# Altium project LogNController-v1.1.PrjPcb (part 1 of 3)
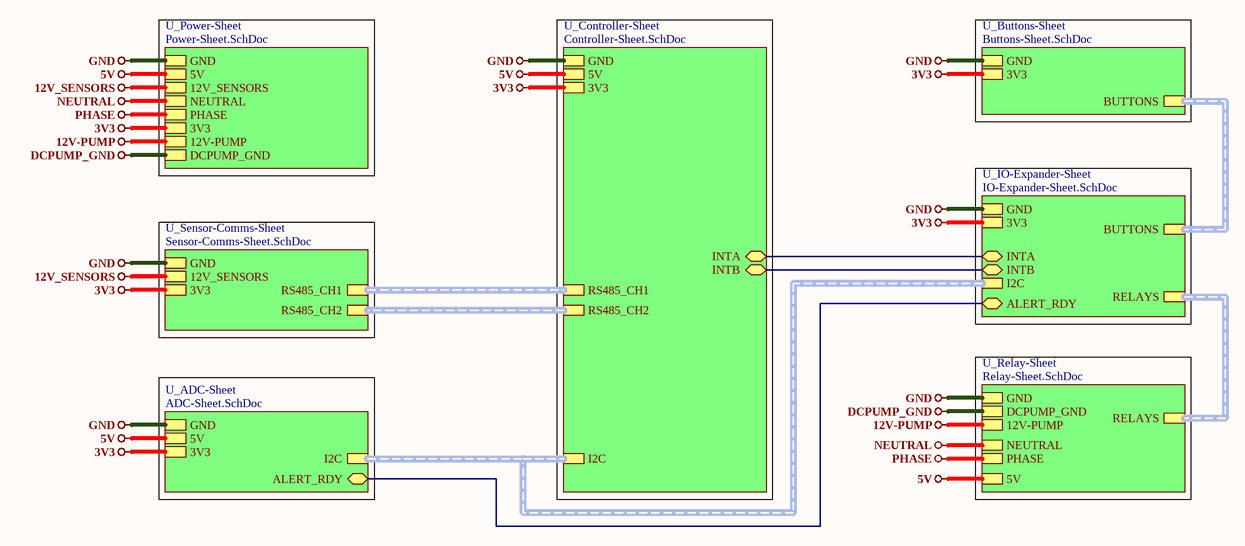
[diagram p0: Top-Sheet.SchDoc]
8 sheets, 172 parts. Net scope: hierarchical (ports join the sheet entries above them; power ports are global).
Board file: PCB_LogNController-v1.1.PcbDoc
Sheets:
  Top-Sheet.SchDoc
    U_Power-Sheet = Power-Sheet.SchDoc
    U_Sensor-Comms-Sheet = Sensor-Comms-Sheet.SchDoc
    U_ADC-Sheet = ADC-Sheet.SchDoc
    U_Buttons-Sheet = Buttons-Sheet.SchDoc
    U_IO-Expander-Sheet = IO-Expander-Sheet.SchDoc
    U_Relay-Sheet = Relay-Sheet.SchDoc
    U_Controller-Sheet = Controller-Sheet.SchDoc

## Sheet Top-Sheet.SchDoc
size A4; SheetNumber: 1; SheetTotal: 8

### Sub-sheets
U_ADC-Sheet = ADC-Sheet.SchDoc: GND, 5V, 3V3, ALERT_RDY (bidir), I2C (harness I2C)
U_Buttons-Sheet = Buttons-Sheet.SchDoc: GND, 3V3, BUTTONS (harness BUTTONS)
U_Controller-Sheet = Controller-Sheet.SchDoc: GND, 5V, 3V3, I2C (harness I2C), RS485_CH2 (harness RS485_CH2), RS485_CH1 (harness RS485_CH1), INTB (bidir), INTA (bidir)
U_IO-Expander-Sheet = IO-Expander-Sheet.SchDoc: GND, 3V3, BUTTONS (harness BUTTONS), ALERT_RDY (bidir), RELAYS (harness RELAYS), INTB (bidir), INTA (bidir), I2C (harness I2C)
U_Power-Sheet = Power-Sheet.SchDoc: GND, 5V, 12V_SENSORS, NEUTRAL, PHASE, 3V3, 12V-PUMP, DCPUMP_GND
U_Relay-Sheet = Relay-Sheet.SchDoc: RELAYS (harness RELAYS), GND, 5V, NEUTRAL, PHASE, 12V-PUMP, DCPUMP_GND
U_Sensor-Comms-Sheet = Sensor-Comms-Sheet.SchDoc: GND, 12V_SENSORS, 3V3, RS485_CH2 (harness RS485_CH2), RS485_CH1 (harness RS485_CH1)

### Nets
3V3: sheet U_Power-Sheet/3V3, sheet U_Sensor-Comms-Sheet/3V3, sheet U_ADC-Sheet/3V3, sheet U_Buttons-Sheet/3V3, sheet U_IO-Expander-Sheet/3V3, sheet U_Controller-Sheet/3V3
5V: sheet U_Power-Sheet/5V, sheet U_ADC-Sheet/5V, sheet U_Relay-Sheet/5V, sheet U_Controller-Sheet/5V
12V-PUMP: sheet U_Power-Sheet/12V-PUMP, sheet U_Relay-Sheet/12V-PUMP
12V_SENSORS: sheet U_Power-Sheet/12V_SENSORS, sheet U_Sensor-Comms-Sheet/12V_SENSORS
DCPUMP_GND: sheet U_Power-Sheet/DCPUMP_GND, sheet U_Relay-Sheet/DCPUMP_GND
GND: sheet U_Power-Sheet/GND, sheet U_Sensor-Comms-Sheet/GND, sheet U_ADC-Sheet/GND, sheet U_Buttons-Sheet/GND, sheet U_IO-Expander-Sheet/GND, sheet U_Relay-Sheet/GND, sheet U_Controller-Sheet/GND
NEUTRAL: sheet U_Power-Sheet/NEUTRAL, sheet U_Relay-Sheet/NEUTRAL
PHASE: sheet U_Power-Sheet/PHASE, sheet U_Relay-Sheet/PHASE
ALERT_RDY: sheet U_ADC-Sheet/ALERT_RDY, sheet U_IO-Expander-Sheet/ALERT_RDY
INTA: sheet U_IO-Expander-Sheet/INTA, sheet U_Controller-Sheet/INTA
INTB: sheet U_IO-Expander-Sheet/INTB, sheet U_Controller-Sheet/INTB

### Buses and harness runs
harness sheet U_ADC-Sheet/I2C = sheet U_Controller-Sheet/I2C = sheet U_IO-Expander-Sheet/I2C
harness sheet U_Buttons-Sheet/BUTTONS = sheet U_IO-Expander-Sheet/BUTTONS
harness sheet U_Controller-Sheet/RS485_CH1 = sheet U_Sensor-Comms-Sheet/RS485_CH1
harness sheet U_Controller-Sheet/RS485_CH2 = sheet U_Sensor-Comms-Sheet/RS485_CH2
harness sheet U_IO-Expander-Sheet/RELAYS = sheet U_Relay-Sheet/RELAYS

### Notes on the sheet
- File:
- Title:
- Date:
- Page
- Num:
- Total:
- Drawn By: Huzaifa Ali

## Sheet Power-Sheet.SchDoc
size A4; SheetNumber: 2; SheetTotal: 8
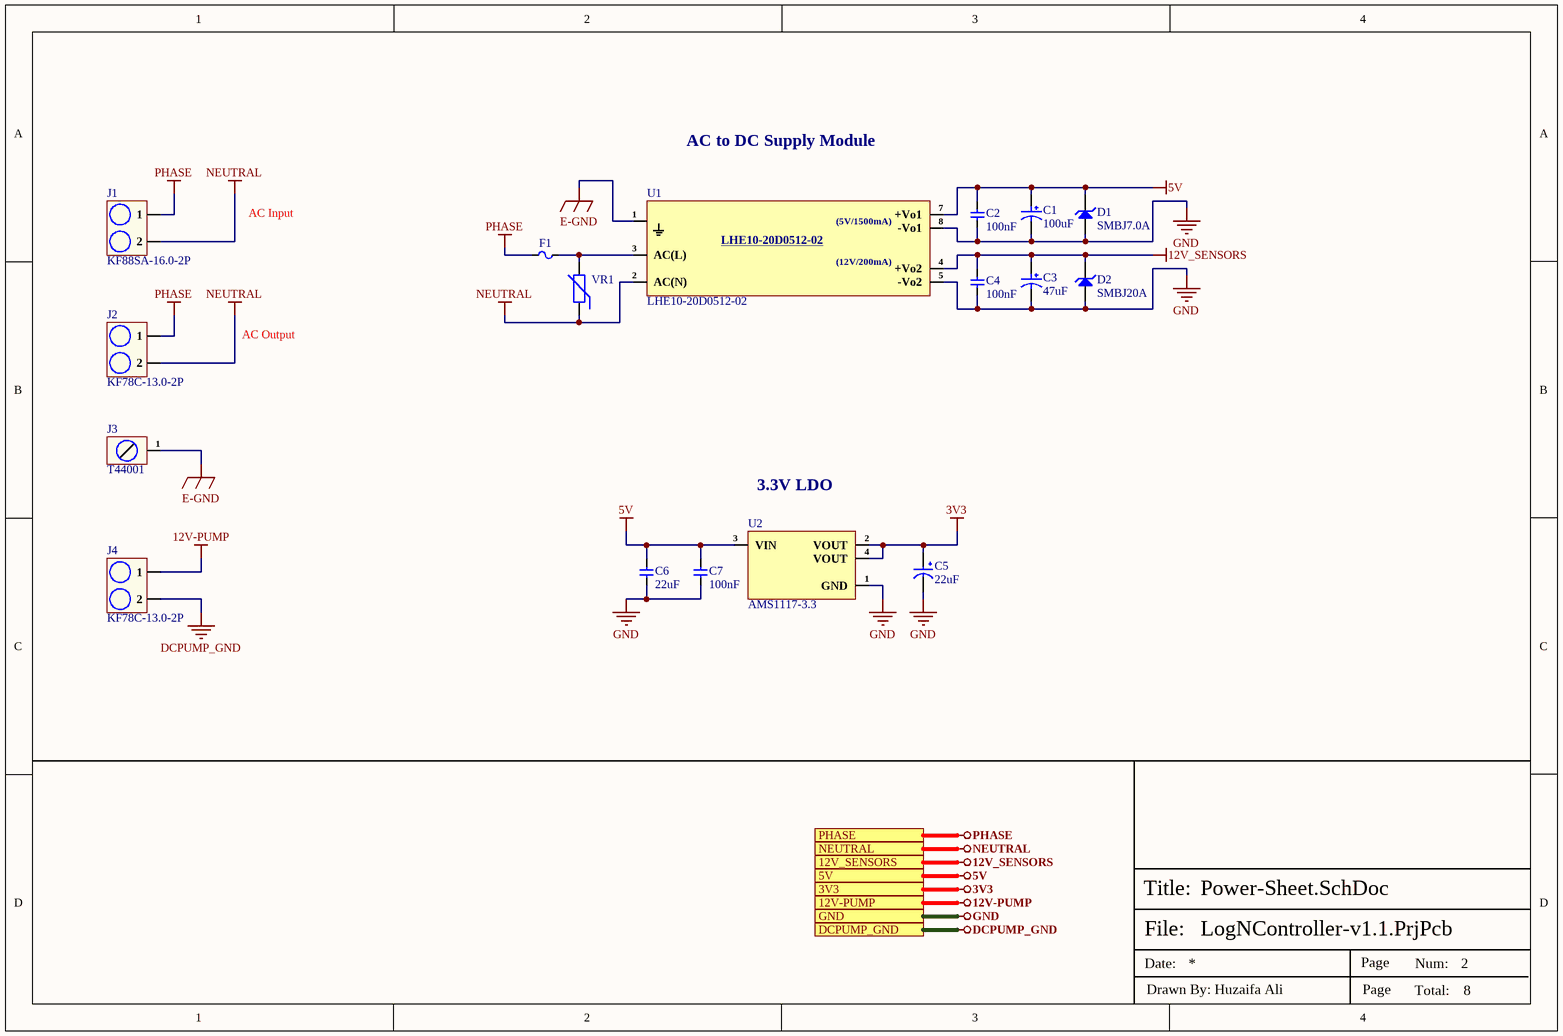
[diagram p1: Power-Sheet.SchDoc]

### Parts
C1  100uF  [25SVPF100M.]
C2  100nF  [Cap-0603]
C3  47uF  [RVT1H470M0607]
C4  100nF  [Cap-0603]
C5  22uF  [Case-B]
C6  22uF  [Cap-0603]
C7  100nF  [Cap-0603]
D1  SMBJ7.0A  [SMB_]
D2  SMBJ20A  [SMB_]
F1  2010T1A250V  [2010T1A250V]  (value not drawn)
J1  KF88SA-16.0-2P  [KF88SA-16.0-2P]
J2  KF78C-13.0-2P  [KF78C-13.0-2P]
J3  T44001  [T44001]
J4  KF78C-13.0-2P  [KF78C-13.0-2P]
U1  LHE10-20D0512-02  [LHE10-20D0512-02]
U2  AMS1117-3.3  [SOT- 223]
VR1  V300LT20AP  [V300LT20AP]  (value not drawn)

### Ports
3V3 (see Top-Sheet[1B], ADC-Sheet[3D], Buttons-Sheet[3D], Controller-Sheet[3D], IO-Expander-Sheet[3D], Sensor-Comms-Sheet[3D]), 5V (see Top-Sheet[1A], ADC-Sheet[3D], Controller-Sheet[3D], Relay-Sheet[3D]), 12V-PUMP (see Top-Sheet[1B], Relay-Sheet[3D]), 12V_SENSORS (see Top-Sheet[1A], Sensor-Comms-Sheet[3D]), DCPUMP_GND (see Top-Sheet[1B], Relay-Sheet[3D]), GND (see Top-Sheet[1A], ADC-Sheet[3D], Buttons-Sheet[3D], Controller-Sheet[3D], IO-Expander-Sheet[3D], Relay-Sheet[3D], Sensor-Comms-Sheet[3D]), NEUTRAL (see Top-Sheet[1A], Relay-Sheet[3D]), PHASE (see Top-Sheet[1B], Relay-Sheet[3D])

### Nets
3V3: C5.1 U2.2(VOUT) U2.4(VOUT) ; port 3V3
5V: C1.1 C2.2 C6.2 C7.2 D1.2(K) U1.7(+Vo1) U2.3(VIN) ; port 5V
12V-PUMP: J4.1 ; port 12V-PUMP
12V_SENSORS: C3.1 C4.2 D2.2(K) U1.4(+Vo2) ; port 12V_SENSORS
DCPUMP_GND: J4.2 ; port DCPUMP_GND
E-GND: J3.1 U1.1
GND: C1.2 C2.1 C3.2 C4.1 C5.2 C6.1 C7.1 D1.1(A) D2.1(A) U1.5(-Vo2) U1.8(-Vo1) U2.1(GND) ; port GND
NEUTRAL: J1.2 J2.2 U1.2(AC(N)) VR1.1 ; port NEUTRAL
PHASE: F1.1 J1.1 J2.1 ; port PHASE
NetF1_2: F1.2 U1.3(AC(L)) VR1.2

### Notes on the sheet
- AC to DC Supply Module
- AC Input
- AC Output
- (near U2) 3.3V LDO
- File:
- Title:
- Date:
- Page
- Num:
- Total:
- Drawn By: Huzaifa Ali
- (in symbol LHE10-20D0512-02) (5V/1500mA); (12V/200mA)

### Library data of the parts
C1 = 25SVPF100M: CAP ALUM POLY 100UF 20% 25V SMD; Manufacturer: Panasonic; Ripple Current: 3.2A; ESR (Equivalent Series Resistance): 24mR; Leakage Current: 500uA; Life (Hours): 5000Hour; Dissipation Factor: 12%; Item Type: Capacitor; Supplier 1: Digi-Key; Manufacturer Part Number: 25SVPF100M; RoHS: Yes; Category: Aluminum Electrolytic Capacitors; Stock 1: 5809; Pricing 1: 1=1.68000, 10=1.32800, 50=1.15080, 100=0.99590, 500=0.75246 (USD); Mount: Surface Mount; Case/Package: Radial; Number of Pins: 7; Min Operating Temperature: -55°C; Max Operating Temperature: 105°C; Capacitance: 100uF; Tolerance: 20%; Voltage Rating: 25V; Ripple Current (AC): 3.2A; Packaging: Tape and Reel; Package Quantity: 1000; Voltage Rating (DC): 25V; Termination: SMD/SMT; Voltage: 25V; Series: OS-CON, SVPF; Diameter: 8mm; Length: 6.9mm; Height: 6.9mm; Height - Seated (Max): 0.276inch; Reach SVHC Compliant: Yes; Lead Free: Lead Free; RoHS Compliant: Yes; ComponentLink1URL: https://datasheet.ciiva.com/25746/1734360-25746518.pdf?src-supplier=Farnell; ComponentLink1Description: https://datasheet.ciiva.com/25746/1734360-25746518.pdf?src-supplier=Farnell; ComponentLink2URL: https://datasheet.ciiva.com/22746/1734360-22746213.pdf?src-supplier=Element14; ComponentLink2Description: https://datasheet.ciiva.com/22746/1734360-22746213.pdf?src-supplier=Element14; ComponentLink3URL: https://datasheet.ciiva.com/24064/svpf-os-262415-24064540.pdf?src-supplier=Mouser; ComponentLink3Description: https://datasheet.ciiva.com/24064/svpf-os-262415-24064540.pdf?src-supplier=Mouser; Supplier Part Number 1: P123675CT-ND; LCSC Part Number: C136279
C2 C4 C7 = CC0603KRX5R9BB104: CAP CER 0.1UF 50V X5R 0603; Manufacturer: Yageo; Tolerance: 10%; Item Type: Capacitor; Supplier 1: Digi-Key; Manufacturer Part Number: CC0603KRX5R9BB104; RoHS: Yes; Category: Ceramic Capacitors; Stock 1: 152253; Pricing 1: 1=0.10000, 10=0.05200, 50=0.02820, 100=0.02310, 500=0.01648, 1000=0.01294 (USD); Mount: Surface Mount; Case/Package: 0603; Case Code (Imperial): 0603; Case Code (Metric): 1608; Weight: 7.1E-05oz; Min Operating Temperature: -55°C; Max Operating Temperature: 85°C; Capacitance: 100nF; Packaging: Tape and Reel; Voltage Rating: 50V; Dielectric: X5R; Termination: SMD/SMT; Voltage Rating (DC): 50V; Package Quantity: 4000; Length: 0.063inch; Width: 0.031inch; Thickness: 0.035inch; Lead Free: Lead Free; Halogen Free: Halogen Free; ComponentLink1URL: http://www.mouser.com/ds/2/447/Yageo_UPY-GP_NP0_16V-to-50V_9-358835.pdf?src-supplier=Mouser; ComponentLink1Description: http://www.mouser.com/ds/2/447/Yageo_UPY-GP_NP0_16V-to-50V_9-358835.pdf?src-supplier=Mouser; ComponentLink2URL: https://www.yageo.com/upload/media/product/productsearch/datasheet/mlcc/UPY-GPHC_X5R_4V-to-50V_26.pdf?src-supplier=Digi-Key; ComponentLink2Description: https://www.yageo.com/upload/media/product/productsearch/datasheet/mlcc/UPY-GPHC_X5R_4V-to-50V_26.pdf?src-supplier=Digi-Key; ComponentLink3URL: http://www.yageo.com/exep/pages/download/literatures/ProductSelectionGuide%202014_Final_2.pdf?src-supplier=Digi-Key; ComponentLink3Description: http://www.yageo.com/exep/pages/download/literatures/ProductSelectionGuide%202014_Final_2.pdf?src-supplier=Digi-Key; Supplier Part Number 1: 311-4046-1-ND; LCSC Part Number: C110022
C3 = RVT1H470M0607: 47uF 50V 66mA@120Hz ±20% SMD,D6.3xL7.7mm Aluminum Electrolytic Capacitors - SMD ROHS; Manufacturer: ROQANG; Manufacturer Part Number: RVT1H470M0607; Package: SMD,D6.3xL7.7mm; LCSC Part Number: C72523; Item Type: Capacitor; ComponentLink1Description: LCSC; ComponentLink1URL: https://www.lcsc.com/product-detail/Aluminum-Electrolytic-Capacitors-SMD_ROQANG-RVT1H470M0607_C72523.html
C5 = TAJB226K016RNJ: CAP TANT 22UF 10% 16V 1411; Manufacturer: Kyocera AVX; Item Type: Tantalum Capacitor; Manufacturer Part Number: TAJB226K016RNJ; Package: CASE-B-3528; LCSC Part Number: C8020; ComponentLink1Description: LCSC; ComponentLink1URL: https://www.lcsc.com/product-detail/Tantalum-Capacitors_Kyocera-AVX-TAJB226K016RNJ_C8020.html
C6 = CC0603MRX5R6BB226: CAP CER 22UF 10V X5R 0603; Manufacturer: Yageo; Tolerance: 20%; Item Type: Capacitor; Supplier 1: Digi-Key; Manufacturer Part Number: CC0603MRX5R6BB226; RoHS: Yes; Category: Ceramic Capacitors; Stock 1: 19628; Pricing 1: 1=0.68000, 10=0.48000, 50=0.36300, 100=0.31610, 500=0.23416, 1000=0.19903 (USD); Mount: Surface Mount; Case/Package: 0603; Case Code (Metric): 1608; Case Code (Imperial): 0603; Weight: 7.1E-05oz; Min Operating Temperature: -55°C; Max Operating Temperature: 85°C; Packaging: Tape and Reel; Capacitance: 22uF; Voltage Rating: 10V; Dielectric: X5R; Termination: SMD/SMT; Voltage Rating (DC): 10V; Package Quantity: 4000; Length: 0.063inch; Width: 0.8mm; Height: 0.8mm; Thickness: 0.035inch; Lead Free: Lead Free; Halogen Free: Halogen Free; RoHS Compliant: Yes; ComponentLink1URL: http://www.mouser.com/ds/2/447/Yageo_UPY-GP_NP0_16V-to-50V_9-358835.pdf?src-supplier=Mouser; ComponentLink1Description: http://www.mouser.com/ds/2/447/Yageo_UPY-GP_NP0_16V-to-50V_9-358835.pdf?src-supplier=Mouser; ComponentLink2URL: http://www.yageo.com/documents/recent/UPY-GPHC_X5R_4V-to-50V_25.pdf?src-supplier=Digi-Key; ComponentLink2Description: http://www.yageo.com/documents/recent/UPY-GPHC_X5R_4V-to-50V_25.pdf?src-supplier=Digi-Key; Supplier Part Number 1: 311-1819-1-ND; LCSC Part Number: C109447
D1 = SMBJ7.0A: 50A 600W 12V 7.78V 7V SMB Electrostatic and Surge Protection (TVS/ESD) ROHS; Manufacturer: Slkor; Manufacturer Part Number: SMBJ7.0A; Package: SMB; LCSC Part Number: C3019967; Item Type: (TVS/ESD); ComponentLink1Description: LCSC; ComponentLink1URL: https://www.lcsc.com/product-detail/Electrostatic-and-Surge-Protection-TVS-ESD_Slkor-SLKORMICRO-Elec-SMBJ7-0A_C3019967.html
D2 = SMBJ20A: 18.5A 32.4V 22.2V 20V DO-214AA Electrostatic and Surge Protection (TVS/ESD) ROHS; Manufacturer: Slkor; Manufacturer Part Number: SMBJ20A; Package: DO-214AA; LCSC Part Number: C2760886; Item Type: (TVS/ESD); ComponentLink1Description: LCSC; ComponentLink1URL: https://www.lcsc.com/product-detail/Electrostatic-and-Surge-Protection-TVS-ESD_Slkor-SLKORMICRO-Elec-SMBJ20A_C2760886.html
F1 = 2010T1A250V: 1A Plugin Fuses ROHS; Manufacturer: Walter Elec; Item Type: Fuse; Manufacturer Part Number: 2010T1A250V; Package: Plugin; LCSC Part Number: C354900; ComponentLink1Description: LCSC; ComponentLink1URL: https://www.lcsc.com/product-detail/Fuses_Walter-Elec-2010T1A250V_C354900.html
J1 = KF88SA-16.0-2P: 1x2P Barrier Block 2 1 16mm -40℃~+105℃ 76A 1kV Black 6~14 Straight pin 16 Plugin,P=16mm Barrier Terminal Blocks ROHS; Manufacturer: CiXi KaiFeng Electronics; Supplier: LCSC; LCSC Part Number: C707749; Manufacturer Part Number: KF88SA-16.0-2P; RoHS: No; Item Type: Terminal Block; ComponentLink1Description: LCSC; ComponentLink1URL: https://www.lcsc.com/product-detail/Barrier-Terminal-Blocks_Cixi-Kefa-Elec-KF88SA-16-0-2P_C707749.html
J2 J4 = KF78C-13.0-2P: 1x2P Midfoot Barrier Block 2 1 13mm 40A -40℃~+105℃ 750V Black 10~18 Straight pin 6 Plugin,P=13mm Barrier Terminal Blocks ROHS; Manufacturer: CiXi KaiFeng Electronics; Supplier: LCSC; LCSC Part Number: C707721; Manufacturer Part Number: KF78C-13.0-2P; RoHS: No; Item Type: Terminal Block
J3 = T44001: M4 Plugin PCB Welding Terminal ROHS; Manufacturer: XFCN; Manufacturer Part Number: T44001; Package: Plugin; ComponentLink1Description: LCSC; ComponentLink1URL: *
U1 = LHE10-20D0512-02: Power supply module ROHS; Manufacturer: LZTEC; Manufacturer Part Number: LHE10-20D0512-02; Package: Custom; LCSC Part Number: C19192878; Item Type: Module; ComponentLink1Description: LCSC; ComponentLink1URL: https://www.lcsc.com/product-detail/Power-supply-module_LZTEC-LHE10-20D0512-02_C19192878.html
U2 = AMS1117-3.3: SOT-223 Linear Voltage Regulators (LDO) ROHS; Manufacturer: GUOXIN JIAPIN SEMICONDUCTOR; Item Type: IC; Manufacturer Part Number: AMS1117-3.3; Package: SOT-223; LCSC Part Number: C2992570; ComponentLink1Description: LCSC; ComponentLink1URL: https://www.lcsc.com/product-detail/Linear-Voltage-Regulators-LDO_GUOXIN-JIAPIN-SEMICONDUCTOR-AMS1117-3-3_C2992570.html
VR1 = V300LT20AP: 775V 405V 300V 470V Plugin Varistors ROHS; Manufacturer: Littelfuse; Supplier: Digikey; LCSC Part Number: C179067; Manufacturer Part Number: V300LT20AP; RoHS: Yes; Item Type: Varistors; Stock: 3169; Pricing: 1=0.45, 10=0.398, 25=0.3736, 100=0.3048 (USD); ComponentLink1URL: https://datasheet.ciiva.com/4541/littelfuse-mov-la-34212-4541978.pdf?src-supplier=Mouser; ComponentLink1Description: https://datasheet.ciiva.com/4541/littelfuse-mov-la-34212-4541978.pdf?src-supplier=Mouser; ComponentLink2URL: https://datasheet.ciiva.com/367/littelfuse-mov-la-367663.pdf?src-supplier=Digikey; ComponentLink2Description: https://datasheet.ciiva.com/367/littelfuse-mov-la-367663.pdf?src-supplier=Digikey

## Sheet Sensor-Comms-Sheet.SchDoc
size A4; SheetNumber: 4; SheetTotal: 8
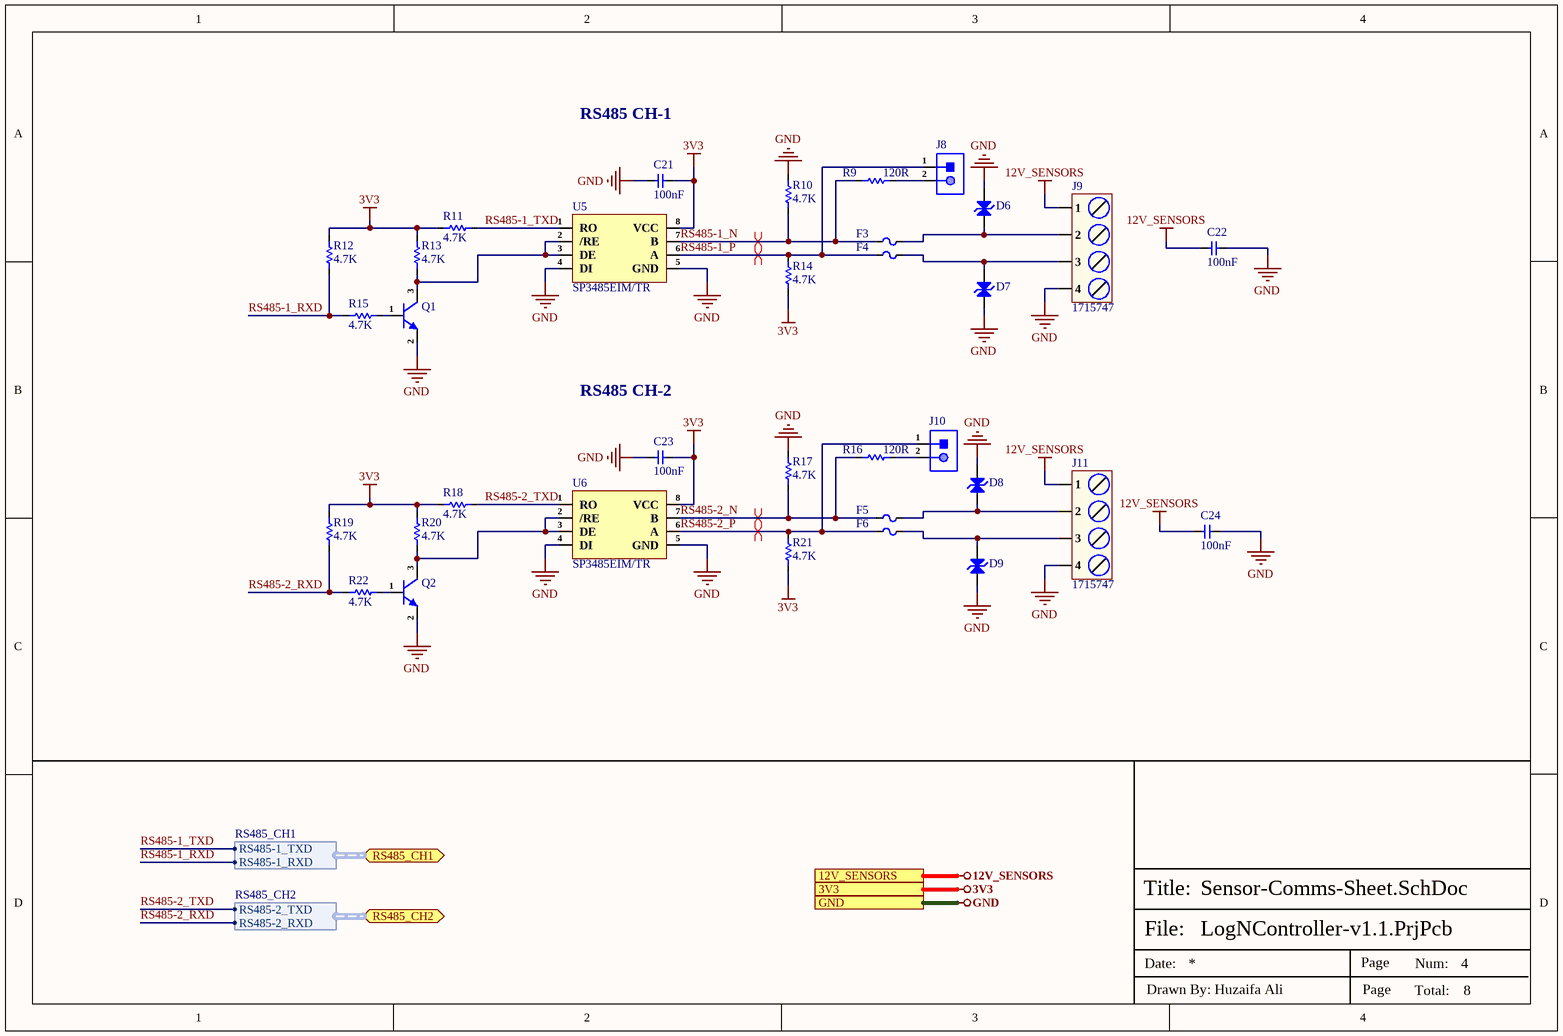
[diagram p2: Sensor-Comms-Sheet.SchDoc]

### Parts
C21  100nF  [Cap-0603]
C22  100nF  [Cap-0603]
C23  100nF  [Cap-0603]
C24  100nF  [Cap-0603]
D6  SMAJ12CA  [SMA Bi Directional]  (value not drawn)
D7  SMAJ12CA  [SMA Bi Directional]  (value not drawn)
D8  SMAJ12CA  [SMA Bi Directional]  (value not drawn)
D9  SMAJ12CA  [SMA Bi Directional]  (value not drawn)
F3  SMD0805P020TF  [Fuse-0805]  (value not drawn)
F4  SMD0805P020TF  [Fuse-0805]  (value not drawn)
F5  SMD0805P020TF  [Fuse-0805]  (value not drawn)
F6  SMD0805P020TF  [Fuse-0805]  (value not drawn)
J8  X6511WV-02H-C60D30  [HDR1X2_]  (value not drawn)
J9  1715747  [1715747]
J10  X6511WV-02H-C60D30  [HDR1X2_]  (value not drawn)
J11  1715747  [1715747]
Q1  MMBT3904M  [SOT-723]  (value not drawn)
Q2  MMBT3904M  [SOT-723]  (value not drawn)
R9  120R  [Res-0603]
R10  4.7K  [Res-0603]
R11  4.7K  [Res-0603]
R12  4.7K  [Res-0603]
R13  4.7K  [Res-0603]
R14  4.7K  [Res-0603]
R15  4.7K  [Res-0603]
R16  120R  [Res-0603]
R17  4.7K  [Res-0603]
R18  4.7K  [Res-0603]
R19  4.7K  [Res-0603]
R20  4.7K  [Res-0603]
R21  4.7K  [Res-0603]
R22  4.7K  [Res-0603]
U5  SP3485EIM/TR  [SOP-8]
U6  SP3485EIM/TR  [SOP-8]

### Ports
3V3 (see Top-Sheet[1B], ADC-Sheet[3D], Buttons-Sheet[3D], Controller-Sheet[3D], IO-Expander-Sheet[3D], Power-Sheet[3D]), 12V_SENSORS (see Top-Sheet[1B], Power-Sheet[3D]), GND (see Top-Sheet[1B], ADC-Sheet[3D], Buttons-Sheet[3D], Controller-Sheet[3D], IO-Expander-Sheet[3D], Power-Sheet[3D], Relay-Sheet[3D]), RS485_CH1 (bidir, harness RS485_CH1, see Top-Sheet[2B], Controller-Sheet[1D]), RS485_CH2 (bidir, harness RS485_CH2, see Top-Sheet[2B], Controller-Sheet[1D])

### Harnesses
RS485_CH2: RS485-2_TXD, RS485-2_RXD
RS485_CH1: RS485-1_TXD, RS485-1_RXD

### Nets
3V3: C21.1 C23.1 R11.1 R12.2 R13.2 R14.1 R18.1 R19.2 R20.2 R21.1 U5.8(VCC) U6.8(VCC) ; port 3V3
12V_SENSORS: C22.2 C24.2 J9.1 J11.1 ; port 12V_SENSORS
GND: C21.2 C22.1 C23.2 C24.1 D6.2(K) D7.1(A) D8.2(K) D9.1(A) J9.4 J11.4 Q1.2(E) Q2.2(E) R10.2 R17.2 U5.4(DI) U5.5(GND) U6.4(DI) U6.5(GND) ; port GND
RS485-1_N: F3.1 R9.1 R10.1 U5.7(B)
RS485-1_P: F4.1 J8.1 R14.2 U5.6(A)
RS485-1_RXD: R12.1 R15.2 ; port RS485_CH1.RS485-1_RXD
RS485-1_TXD: R11.2 U5.1(RO) ; port RS485_CH1.RS485-1_TXD
RS485-2_N: F5.1 R16.1 R17.1 U6.7(B)
RS485-2_P: F6.1 J10.1 R21.2 U6.6(A)
RS485-2_RXD: R19.1 R22.2 ; port RS485_CH2.RS485-2_RXD
RS485-2_TXD: R18.2 U6.1(RO) ; port RS485_CH2.RS485-2_TXD
NetD6_1: D6.1(A) F3.2 J9.2
NetD7_2: D7.2(K) F4.2 J9.3
NetD8_1: D8.1(A) F5.2 J11.2
NetD9_2: D9.2(K) F6.2 J11.3
NetJ8_2: J8.2 R9.2
NetJ10_2: J10.2 R16.2
NetQ1_1: Q1.1(B) R15.1
NetQ1_3: Q1.3(C) R13.1 U5.2(/RE) U5.3(DE)
NetQ2_1: Q2.1(B) R22.1
NetQ2_3: Q2.3(C) R20.1 U6.2(/RE) U6.3(DE)

### Layout directives
differential pair; net class RS485; differential pair class RS485_Lines; rule Impedance Constraint [Min = 120.0    Max = 120.0    ]; rule Matched Net Lengths [Tolerance = 50mil]: RS485-1_N, RS485-1_P, RS485-2_N, RS485-2_P

### Notes on the sheet
- RS485 CH-1
- RS485 CH-2
- File:
- Title:
- Date:
- Page
- Num:
- Total:
- Drawn By: Huzaifa Ali

### Library data of the parts
C21-C24 = CC0603KRX5R9BB104: as C2 on sheet Power-Sheet; Supplier 1: Digi-Key; Manufacturer Part Number: CC0603KRX5R9BB104; RoHS: Yes; Category: Ceramic Capacitors; Stock 1: 152253; Pricing 1: 1=0.10000, 10=0.05200, 50=0.02820, 100=0.02310, 500=0.01648, 1000=0.01294 (USD); Mount: Surface Mount; Case/Package: 0603; Case Code (Imperial): 0603; Case Code (Metric): 1608; Weight: 7.1E-05oz; Min Operating Temperature: -55°C; Max Operating Temperature: 85°C; Capacitance: 100nF; Packaging: Tape and Reel; Voltage Rating: 50V; Dielectric: X5R; Termination: SMD/SMT; Voltage Rating (DC): 50V; Package Quantity: 4000; Length: 0.063inch; Width: 0.031inch; Thickness: 0.035inch; Lead Free: Lead Free; Halogen Free: Halogen Free; ComponentLink1URL: http://www.mouser.com/ds/2/447/Yageo_UPY-GP_NP0_16V-to-50V_9-358835.pdf?src-supplier=Mouser; ComponentLink1Description: http://www.mouser.com/ds/2/447/Yageo_UPY-GP_NP0_16V-to-50V_9-358835.pdf?src-supplier=Mouser; ComponentLink2URL: https://www.yageo.com/upload/media/product/productsearch/datasheet/mlcc/UPY-GPHC_X5R_4V-to-50V_26.pdf?src-supplier=Digi-Key; ComponentLink2Description: https://www.yageo.com/upload/media/product/productsearch/datasheet/mlcc/UPY-GPHC_X5R_4V-to-50V_26.pdf?src-supplier=Digi-Key; ComponentLink3URL: http://www.yageo.com/exep/pages/download/literatures/ProductSelectionGuide%202014_Final_2.pdf?src-supplier=Digi-Key; ComponentLink3Description: http://www.yageo.com/exep/pages/download/literatures/ProductSelectionGuide%202014_Final_2.pdf?src-supplier=Digi-Key; Supplier Part Number 1: 311-4046-1-ND; LCSC Part Number: C110022
D6-D9 = SMAJ12CA: 20.1A 19.9V 13.3V 12V SMA(DO-214AC) Electrostatic and Surge Protection (TVS/ESD) ROHS; Manufacturer: MDD; Manufacturer Part Number: SMAJ12CA; Package: SMA(DO-214AC); LCSC Part Number: C110042; Item Type: (TVS/ESD); ComponentLink1Description: LCSC; ComponentLink1URL: https://www.lcsc.com/product-detail/Electrostatic-and-Surge-Protection-TVS-ESD_MDD-Microdiode-Semiconductor-SMAJ12CA_C110042.html
F3-F6 = SMD0805P020TF: 9V 200mA 100A 500mA 0805 Resettable Fuses ROHS; Manufacturer: RUILON; Item Type: Fuse; Manufacturer Part Number: SMD0805P020TF; Package: 0805; LCSC Part Number: C20976; ComponentLink1Description: LCSC; ComponentLink1URL: https://www.lcsc.com/product-detail/Resettable-Fuses_RUILON-Shenzhen-Ruilongyuan-Elec-SMD0805P020TF_C20976.html
J8 J10 = X6511WV-02H-C60D30: Gold 250V 3A Straight Square Pins 2.5mm 2P 260℃ 6mm -40℃~+105℃ 3mm 2.54mm Plugin Black Brass 1x2P Plugin,P=2.54mm Pin Headers ROHS; Manufacturer: XKB; Item Type: Male Header; Manufacturer Part Number: X6511WV-02H-C60D30; Package: Plugin,P=2.54mm; LCSC Part Number: C706874; ComponentLink1Description: LCSC; ComponentLink1URL: https://www.lcsc.com/product-detail/Pin-Headers_XKB-Connectivity-X6511WV-02H-C60D30_C706874.html
J9 J11 = 1715747: TERM BLK 4P SIDE ENT 5.08MM PCB; Manufacturer: Phoenix Contact; Item Type: Terminal Blocks; Supplier: Digikey; Supplier Part Number: 277-1265-ND; Manufacturer Part Number: 1715747; RoHS: Yes; Stock: 3401; Pricing: 1=2.39, 10=2.287, 50=2.188, 100=2.1282, 250=1.989, 500=1.82988, 1000=1.79562 (USD); ComponentLink1URL: https://datasheet.ciiva.com/16071/1715747-16071928.pdf?src-supplier=Onlinecomponents.com; ComponentLink1Description: https://datasheet.ciiva.com/16071/1715747-16071928.pdf?src-supplier=Onlinecomponents.com; ComponentLink2URL: https://datasheet.ciiva.com/23596/100425-23596240.pdf?src-supplier=Newark; ComponentLink2Description: https://datasheet.ciiva.com/23596/100425-23596240.pdf?src-supplier=Newark; ComponentLink3URL: https://datasheet.ciiva.com/15169/getdatasheetpartid-227081-15169962.pdf?src-supplier=Verical; ComponentLink3Description: https://datasheet.ciiva.com/15169/getdatasheetpartid-227081-15169962.pdf?src-supplier=Verical; ComponentLink4URL: https://datasheet.ciiva.com/11757/0900766b811d7317-11757713.pdf?src-supplier=Rs; ComponentLink4Description: https://datasheet.ciiva.com/11757/0900766b811d7317-11757713.pdf?src-supplier=Rs; ComponentLink5URL: https://datasheet.ciiva.com/824/1715747-824336.pdf?src-supplier=Digikey; ComponentLink5Description: https://datasheet.ciiva.com/824/1715747-824336.pdf?src-supplier=Digikey; ComponentLink6URL: https://datasheet.ciiva.com/1120/1731555-1120440.pdf?src-supplier=Farnell; ComponentLink6Description: https://datasheet.ciiva.com/1120/1731555-1120440.pdf?src-supplier=Farnell; ComponentLink7URL: https://datasheet.ciiva.com/1118/1731555-1118428.pdf?src-supplier=Element14; ComponentLink7Description: https://datasheet.ciiva.com/1118/1731555-1118428.pdf?src-supplier=Element14; ComponentLink8URL: https://datasheet.ciiva.com/33106/1715747-33106010.pdf?src-supplier=Today+Components; ComponentLink8Description: https://datasheet.ciiva.com/33106/1715747-33106010.pdf?src-supplier=Today+Components; ComponentLink9URL: https://datasheet.ciiva.com/29218/743477-da-01-en-printklemmenblock-mkds-1-5-4-5-08-29218070.pdf?src-supplier=Conrad; ComponentLink9Description: https://datasheet.ciiva.com/29218/743477-da-01-en-printklemmenblock-mkds-1-5-4-5-08-29218070.pdf?src-supplier=Conrad
Q1 Q2 = MMBT3904M: 40V 100mW 100@10mA,1V 200mA 300MHz 300mV@50mA,5mA NPN -55℃~+150℃@(Tj) SOT-723 Bipolar Transistors - BJT ROHS; Manufacturer: TECH PUBLIC; Item Type: Mosfet; ComponentLink1Description: LCSC; ComponentLink1URL: https://www.lcsc.com/product-detail/Bipolar-Transistors-BJT_TECH-PUBLIC-MMBT3904M_C2923360.html; Manufacturer Part Number: MMBT3904M; Package: SOT-723; LCSC Part Number: C2923360
R9 R16 = RC0603FR-07120RL: RES 120 OHM 1% 1/10W 0603; Manufacturer: Yageo; Temperature Coefficient: 100ppm/°C; Voltage Rating (DC): 50V; Power Rating: 100mW; Item Type: Resistor; Supplier 1: Digi-Key; Manufacturer Part Number: RC0603FR-07120RL; RoHS: Yes; Category: Chip SMD Resistors; Stock 1: 839061; Pricing 1: 1=0.10000, 10=0.02400, 100=0.00970, 1000=0.00436, 2500=0.00378 (USD); Case/Package: 0603; Number of Pins: 2; Case Code (Metric): 1608; Case Code (Imperial): 0603; Size Code: 0603; Min Operating Temperature: -55°C; Max Operating Temperature: 155°C; Resistance: 120R; Tolerance: 1%; Resistor Type: Thick Film; Packaging: Tape and Reel; Voltage Rating: 50V; Package Quantity: 1; Number of Terminations: 2; Termination: SMD/SMT; Max Power Dissipation: 100mW; Features: Moisture Resistant; Series: RC; Construction: Rectangular; Resistance Tolerance: 1%; Length: 1.6mm; Width: 0.031inch; Height: 0.022inch; Depth: 0.8mm; REACH SVHC: No SVHC; Lead Free: Lead Free; Military Standard: Not; RoHS Compliant: Yes; ComponentLink1URL: https://datasheet.ciiva.com/2553/pyu-r-int-thick-7-2553512.pdf?src-supplier=Digi-Key; ComponentLink1Description: https://datasheet.ciiva.com/2553/pyu-r-int-thick-7-2553512.pdf?src-supplier=Digi-Key; ComponentLink2URL: https://datasheet.ciiva.com/7746/443971-7746248.pdf?src-supplier=Element14; ComponentLink2Description: https://datasheet.ciiva.com/7746/443971-7746248.pdf?src-supplier=Element14; ComponentLink3URL: https://datasheet.ciiva.com/2553/pyu-r-int-thick-7-2553513.pdf?src-supplier=Digi-Key; ComponentLink3Description: https://datasheet.ciiva.com/2553/pyu-r-int-thick-7-2553513.pdf?src-supplier=Digi-Key; ComponentLink4URL: https://datasheet.ciiva.com/7746/443971-7746249.pdf?src-supplier=Element14; ComponentLink4Description: https://datasheet.ciiva.com/7746/443971-7746249.pdf?src-supplier=Element14; ComponentLink5URL: https://datasheet.ciiva.com/2553/pyu-r-int-thick-7-2553514.pdf?src-supplier=Digi-Key; ComponentLink5Description: https://datasheet.ciiva.com/2553/pyu-r-int-thick-7-2553514.pdf?src-supplier=Digi-Key; ComponentLink6URL: https://datasheet.ciiva.com/46395/443971-46395021.pdf?src-supplier=Element14; ComponentLink6Description: https://datasheet.ciiva.com/46395/443971-46395021.pdf?src-supplier=Element14; Supplier Part Number 1: 311-120HRCT-ND; LCSC Part Number: C114640
R10-R15 R17-R22 = RC0603FR-074K7L: RES SMD 4.7K OHM 1% 1/10W 0603; Manufacturer: Yageo; Item Type: Resistor; Manufacturer Part Number: RC0603FR-074K7L; Package: 0603; ComponentLink7Description: LCSC; ComponentLink7URL: https://www.lcsc.com/product-detail/Chip-Resistor-Surface-Mount_YAGEO-RC0603FR-074K7L_C99782.html; LCSC Part Number: C99782
U5 U6 = SP3485EIM/TR: SOP-8 RS-485/RS-422 ICs ROHS; Manufacturer: HGSEMI; Item Type: IC; Manufacturer Part Number: SP3485EIM/TR; Package: SOP-8; LCSC Part Number: C519086; ComponentLink1Description: LCSC; ComponentLink1URL: https://www.lcsc.com/product-detail/RS-485-RS-422-ICs_HGSEMI-SP3485EIM-TR_C519086.html

## Sheet ADC-Sheet.SchDoc
size A4; SheetNumber: 5; SheetTotal: 8
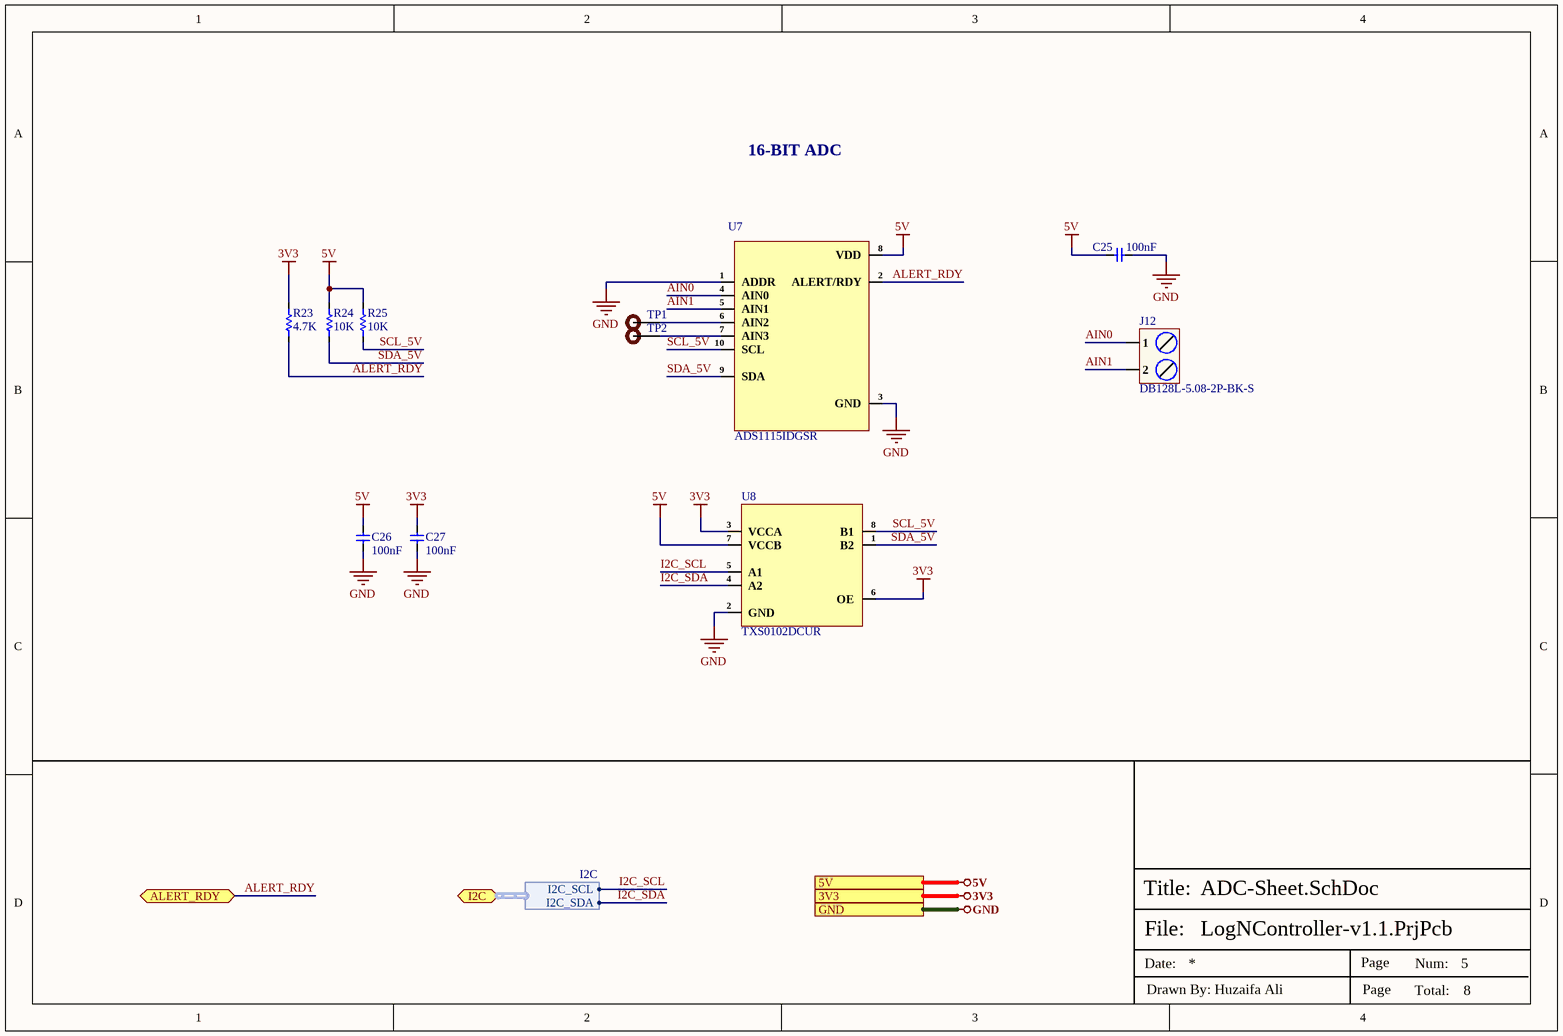
[diagram p3: ADC-Sheet.SchDoc]

### Parts
C25  100nF  [Cap-0603]
C26  100nF  [Cap-0603]
C27  100nF  [Cap-0603]
J12  DB128L-5.08-2P-BK-S  [DB128L-5.08-2P-BK-S]
R23  4.7K  [Res-0402]
R24  10K  [Res-0603]
R25  10K  [Res-0603]
TP1  TEST POINT 0.5mm Dia  [Test-point - 0.5mm]  (value not drawn)  (no BOM)
TP2  TEST POINT 0.5mm Dia  [Test-point - 0.5mm]  (value not drawn)  (no BOM)
U7  ADS1115IDGSR  [VSSOP-10]
U8  TXS0102DCUR  [VSSOP-8(3.1x2.1)]

### Ports
3V3 (see Top-Sheet[1C], Buttons-Sheet[3D], Controller-Sheet[3D], IO-Expander-Sheet[3D], Power-Sheet[3D], Sensor-Comms-Sheet[3D]), 5V (see Top-Sheet[1C], Controller-Sheet[3D], Power-Sheet[3D], Relay-Sheet[3D]), ALERT_RDY (bidir, see Top-Sheet[2C], IO-Expander-Sheet[3D]), GND (see Top-Sheet[1C], Buttons-Sheet[3D], Controller-Sheet[3D], IO-Expander-Sheet[3D], Power-Sheet[3D], Relay-Sheet[3D], Sensor-Comms-Sheet[3D]), I2C (bidir, harness I2C, see Top-Sheet[2C], Controller-Sheet[2D], IO-Expander-Sheet[3D])

### Harnesses
I2C: I2C_SCL, I2C_SDA

### Nets
3V3: C27.1 R23.2 U8.3(VCCA) U8.6(OE) ; port 3V3
5V: C25.2 C26.1 R24.2 R25.2 U7.8(VDD) U8.7(VCCB) ; port 5V
GND: C25.1 C26.2 C27.2 U7.1(ADDR) U7.3(GND) U8.2(GND) ; port GND
AIN0: J12.1 U7.4(AIN0)
AIN1: J12.2 U7.5(AIN1)
ALERT_RDY: R23.1 U7.2(ALERT/RDY) ; port ALERT_RDY
I2C_SCL: U8.5(A1) ; port I2C.I2C_SCL
I2C_SDA: U8.4(A2) ; port I2C.I2C_SDA
SCL_5V: R25.1 U7.10(SCL) U8.8(B1)
SDA_5V: R24.1 U7.9(SDA) U8.1(B2)
NetTP1_1: TP1.1 U7.6(AIN2)
NetTP2_1: TP2.1 U7.7(AIN3)

### Notes on the sheet
- 16-BIT ADC
- File:
- Title:
- Date:
- Page
- Num:
- Total:
- Drawn By: Huzaifa Ali

### Library data of the parts
C25-C27 = CC0603KRX5R9BB104: as C2 on sheet Power-Sheet; Supplier 1: Digi-Key; Manufacturer Part Number: CC0603KRX5R9BB104; RoHS: Yes; Category: Ceramic Capacitors; Stock 1: 152253; Pricing 1: 1=0.10000, 10=0.05200, 50=0.02820, 100=0.02310, 500=0.01648, 1000=0.01294 (USD); Mount: Surface Mount; Case/Package: 0603; Case Code (Imperial): 0603; Case Code (Metric): 1608; Weight: 7.1E-05oz; Min Operating Temperature: -55°C; Max Operating Temperature: 85°C; Capacitance: 100nF; Packaging: Tape and Reel; Voltage Rating: 50V; Dielectric: X5R; Termination: SMD/SMT; Voltage Rating (DC): 50V; Package Quantity: 4000; Length: 0.063inch; Width: 0.031inch; Thickness: 0.035inch; Lead Free: Lead Free; Halogen Free: Halogen Free; ComponentLink1URL: http://www.mouser.com/ds/2/447/Yageo_UPY-GP_NP0_16V-to-50V_9-358835.pdf?src-supplier=Mouser; ComponentLink1Description: http://www.mouser.com/ds/2/447/Yageo_UPY-GP_NP0_16V-to-50V_9-358835.pdf?src-supplier=Mouser; ComponentLink2URL: https://www.yageo.com/upload/media/product/productsearch/datasheet/mlcc/UPY-GPHC_X5R_4V-to-50V_26.pdf?src-supplier=Digi-Key; ComponentLink2Description: https://www.yageo.com/upload/media/product/productsearch/datasheet/mlcc/UPY-GPHC_X5R_4V-to-50V_26.pdf?src-supplier=Digi-Key; ComponentLink3URL: http://www.yageo.com/exep/pages/download/literatures/ProductSelectionGuide%202014_Final_2.pdf?src-supplier=Digi-Key; ComponentLink3Description: http://www.yageo.com/exep/pages/download/literatures/ProductSelectionGuide%202014_Final_2.pdf?src-supplier=Digi-Key; Supplier Part Number 1: 311-4046-1-ND; LCSC Part Number: C110022
J12 = DB128L-5.08-2P-BK-S: 1x2P 18A -40℃~+105℃ 250V Black 12~30 Straight pin 5.08mm 2.5 1 2 Plugin,P=5.08mm Screw terminal ROHS; Manufacturer: DIBO; Item Type: Terminal Block; Manufacturer Part Number: DB128L-5.08-2P-BK-S; Package: Plugin,P=5.08mm; LCSC Part Number: C430601; ComponentLink1Description: LCSC; ComponentLink1URL: https://www.lcsc.com/product-detail/Screw-terminal_span-style-background-color-ff0-DIBO-span-DB128L-5-08-2P-BK-S_C430601.html
R23 = RC0402FR-074K7L: RES 4.7K OHM 1% 1/16W 0402; Manufacturer: Yageo; Voltage Rating (DC): 50V; Power Rating: 62.5mW; Resistance: 4.7kR; Temperature Coefficient: 100ppm/°C; Max Power Dissipation: 63mW; Item Type: Resistor; Supplier 1: Avnet; Manufacturer Part Number: RC0402FR-074K7L; RoHS: Yes; Category: Chip SMD Resistors; Stock 1: 2420000; Pricing 1: 10000=0.00085 (USD); Case/Package: 0402; Number of Pins: 2; Case Code (Imperial): 0402; Case Code (Metric): 1005; Size Code: 0402; Min Operating Temperature: -55°C; Max Operating Temperature: 155°C; Tolerance: 1%; Voltage Rating: 50V; Packaging: Tape and Reel; Resistor Type: Thick Film; Termination: SMD/SMT; Features: Moisture Resistant; Series: RC; Number of Terminations: 2; Resistance Tolerance: 1%; Construction: Rectangular; Length: 1mm; Width: 0.5mm; Height: 0.32mm; Depth: 0.5mm; Height - Seated (Max): 0.016inch; RoHS Compliant: Yes; Reach SVHC Compliant: Yes; Military Standard: Not; Lead Free: Lead Free; ComponentLink1URL: https://datasheet.ciiva.com/22661/1686128-22661342.pdf?src-supplier=Element14; ComponentLink1Description: https://datasheet.ciiva.com/22661/1686128-22661342.pdf?src-supplier=Element14; ComponentLink2URL: https://datasheet.ciiva.com/7850/1018594-7850022.pdf?src-supplier=Element14; ComponentLink2Description: https://datasheet.ciiva.com/7850/1018594-7850022.pdf?src-supplier=Element14; ComponentLink3URL: https://datasheet.ciiva.com/7850/1018594-7850023.pdf?src-supplier=Element14; ComponentLink3Description: https://datasheet.ciiva.com/7850/1018594-7850023.pdf?src-supplier=Element14; ComponentLink4URL: https://datasheet.ciiva.com/15215/getdatasheetpartid-328119-15215035.pdf?src-supplier=Verical; ComponentLink4Description: https://datasheet.ciiva.com/15215/getdatasheetpartid-328119-15215035.pdf?src-supplier=Verical; Supplier Part Number 1: RC0402FR-074K7L; LCSC Part Number: C105871
R24 R25 = RC0603FR-0710KL: RES SMD 10K Ohm 1% 1/10W 0603; Manufacturer: Yageo; Resistance: 10kR; Temperature Coefficient: 100ppm/°C; Voltage Rating (DC): 50V; Power Rating: 100mW; Voltage Rating: 75V; Item Type: Resistor; Supplier 1: Digi-Key; Manufacturer Part Number: RC0603FR-0710KL; RoHS: Yes; Category: Chip SMD Resistors; Stock 1: 25249139; Pricing 1: 1=0.10000, 10=0.02400, 100=0.00970, 1000=0.00436, 2500=0.00378 (USD); Case/Package: 0603; Number of Pins: 2; Case Code (Imperial): 0603; Case Code (Metric): 1608; Weight: 7.1E-05oz; Size Code: 0603; Min Operating Temperature: -55°C; Max Operating Temperature: 155°C; Tolerance: 1%; Resistor Type: Thick Film; Packaging: Tape and Reel; Termination: SMD/SMT; Features: Moisture Resistant; Series: RC; Max Power Dissipation: 100mW; Number of Terminations: 2; Resistance Tolerance: 1%; Construction: Rectangular; Length: 1.6mm; Width: 0.8mm; Height: 0.45mm; Depth: 0.8mm; Lead Pitch: 0.3mm; REACH SVHC: Unknown; Lead Free: Lead Free; Military Standard: Not; RoHS Compliant: Yes; ComponentLink1URL: https://datasheet.ciiva.com/7660/38590-7660789.pdf?src-supplier=Element14; ComponentLink1Description: https://datasheet.ciiva.com/7660/38590-7660789.pdf?src-supplier=Element14; ComponentLink2URL: https://datasheet.ciiva.com/7983/443971-7983596.pdf?src-supplier=Element14; ComponentLink2Description: https://datasheet.ciiva.com/7983/443971-7983596.pdf?src-supplier=Element14; ComponentLink3URL: https://datasheet.ciiva.com/22747/443971-22747519.pdf?src-supplier=Element14; ComponentLink3Description: https://datasheet.ciiva.com/22747/443971-22747519.pdf?src-supplier=Element14; ComponentLink4URL: https://datasheet.ciiva.com/46440/1868787-46440891.pdf?src-supplier=Element14; ComponentLink4Description: https://datasheet.ciiva.com/46440/1868787-46440891.pdf?src-supplier=Element14; ComponentLink5URL: https://datasheet.ciiva.com/7746/1738695-7746239.pdf?src-supplier=Element14; ComponentLink5Description: https://datasheet.ciiva.com/7746/1738695-7746239.pdf?src-supplier=Element14; ComponentLink6URL: https://datasheet.ciiva.com/15189/getdatasheetpartid-409289-15189591.pdf?src-supplier=Verical; ComponentLink6Description: https://datasheet.ciiva.com/15189/getdatasheetpartid-409289-15189591.pdf?src-supplier=Verical; Supplier Part Number 1: 311-10.0KHRCT-ND; LCSC Part Number: C98220
TP1 TP2 = TEST POINT 0.5mm Dia: Test Point ON; Item Type: Test Point; Manufacturer Part Number: TEST POINT 0.5mm Dia
U7 = ADS1115IDGSR: IC ADC 16BIT SIGMA-DELTA 10VSSOP; Manufacturer: Texas Instruments; Interface: I2C; Number of Bits: 16; Sampling Rate: 860S/s; Number of A/D Converters: 1; Resolution: 16b; Polarity: Bipolar; Min Supply Voltage: 2V; Max Supply Voltage: 5.5V; Supply Type: Single; Conversion Rate: 0.86KS/s; Number of Inputs: 4; Integral Nonlinearity (INL): 1LSB; Power Dissipation: 900uW; Nominal Supply Current: 150uA; Number of Channels: 2; Supplier: Mouser; Supplier Part Number: 595-ADS1115IDGSR; Manufacturer Part Number: ADS1115IDGSR; RoHS: Yes; Category: Analog to Digital Converters (ADCs); Stock: 5925; Pricing: 1=5.44, 10=4.76, 50=4.76, 100=4.01, 1000=2.88, 10000=2.78 (USD); Case/Package: VSSOP; Pins: 10; Contact Plating: Gold; Min Operating Temperature: -40°C; Max Operating Temperature: 125°C; Package Quantity: 2500; Packaging: Tape and Reel; Number of Converters: 1; Max Supply Voltage (DC): 5.5V; Min Supply Voltage (DC): 2V; Series: -; Length: 3mm; Width: 3mm; Height: 1.07mm; Thickness: 1.02mm; Reach SVHC Compliant: No; Lead Free: Lead Free; RoHS Compliant: Yes; ComponentLink1URL: https://datasheet.ciiva.com/4031/47725463s8438921n7713-4031028.pdf?src-supplier=Arrow+Electronics; ComponentLink1Description: https://datasheet.ciiva.com/4031/47725463s8438921n7713-4031028.pdf?src-supplier=Arrow+Electronics; LCSC Part Number: C37593; Item Type: IC
U8 = TXS0102DCUR: IC TRANSLTR BIDIRECTIONAL 8VSSOP; Manufacturer: Texas Instruments; Number of Outputs: 2NUMBER; Number of Inputs: 2; Nominal Supply Current: 14.4uA; Output Current: 1A; Min Supply Voltage: 1.65V; Max Supply Voltage: 5.5V; Data Rate: 24Mbps; Propagation Delay: 4.6ns; Logic Function: Translator; Turn-On Delay Time: 260ns; High Level Output Current: -20uA; Low Level Output Current: 1mA; Number of Circuits: 1; Supplier: Mouser; Supplier Part Number: 595-TXS0102DCUR; Manufacturer Part Number: TXS0102DCUR; RoHS: Yes; Category: Voltage Level Shifters; Stock: 149802; Pricing: 1=0.89, 10=0.739, 50=0.739, 100=0.561, 1000=0.383, 10000=0.313 (USD); Case/Package: VSSOP; Pins: 8; Weight: 0.000339oz; Min Operating Temperature: -40°C; Max Operating Temperature: 85°C; Package Quantity: 3000; Number of Channels: 2; Packaging: Tape and Reel; Number of Bits: 2; Quiescent Current: 14.4uA; Series: -; Channel Type: Bidirectional; Length: 2.3mm; Width: 2mm; Height: 900um; Thickness: 850um; Radiation Hardening: No; Reach SVHC Compliant: No; Lead Free: Lead Free; RoHS Compliant: Yes; ComponentLink1URL: https://datasheet.ciiva.com/22653/1846850-22653373.pdf?src-supplier=Farnell; ComponentLink1Description: https://datasheet.ciiva.com/22653/1846850-22653373.pdf?src-supplier=Farnell; ComponentLink2URL: https://datasheet.ciiva.com/15096/getdatasheetpartid-118249-15096172.pdf?src-supplier=Verical; ComponentLink2Description: https://datasheet.ciiva.com/15096/getdatasheetpartid-118249-15096172.pdf?src-supplier=Verical; ComponentLink3URL: https://datasheet.ciiva.com/1508/1857232-1508821.pdf?src-supplier=Element14; ComponentLink3Description: https://datasheet.ciiva.com/1508/1857232-1508821.pdf?src-supplier=Element14; ComponentLink4URL: https://datasheet.ciiva.com/28499/1863639-28499676.pdf?src-supplier=Element14; ComponentLink4Description: https://datasheet.ciiva.com/28499/1863639-28499676.pdf?src-supplier=Element14; ComponentLink5URL: https://datasheet.ciiva.com/46395/1863639-46395871.pdf?src-supplier=Element14; ComponentLink5Description: https://datasheet.ciiva.com/46395/1863639-46395871.pdf?src-supplier=Element14; ComponentLink6URL: https://datasheet.ciiva.com/1899/txs0102-1899369.pdf?src-supplier=Digikey; ComponentLink6Description: https://datasheet.ciiva.com/1899/txs0102-1899369.pdf?src-supplier=Digikey; ComponentLink7URL: https://datasheet.ciiva.com/1899/txs0102-1899368.pdf?src-supplier=Digikey; ComponentLink7Description: https://datasheet.ciiva.com/1899/txs0102-1899368.pdf?src-supplier=Digikey; ComponentLink8URL: https://datasheet.ciiva.com/1899/txs0102-1899370.pdf?src-supplier=Digikey; ComponentLink8Description: https://datasheet.ciiva.com/1899/txs0102-1899370.pdf?src-supplier=Digikey; ComponentLink9URL: https://datasheet.ciiva.com/14287/txs0102-14287516.pdf?src-supplier=Avnet; ComponentLink9Description: https://datasheet.ciiva.com/14287/txs0102-14287516.pdf?src-supplier=Avnet; ComponentLink10URL: https://datasheet.ciiva.com/14287/txs0102-14287518.pdf?src-supplier=Avnet; ComponentLink10Description: https://datasheet.ciiva.com/14287/txs0102-14287518.pdf?src-supplier=Avnet; LCSC Part Number: C53434; Item Type: IC

## Sheet Buttons-Sheet.SchDoc
size A4; SheetNumber: 6; SheetTotal: 8
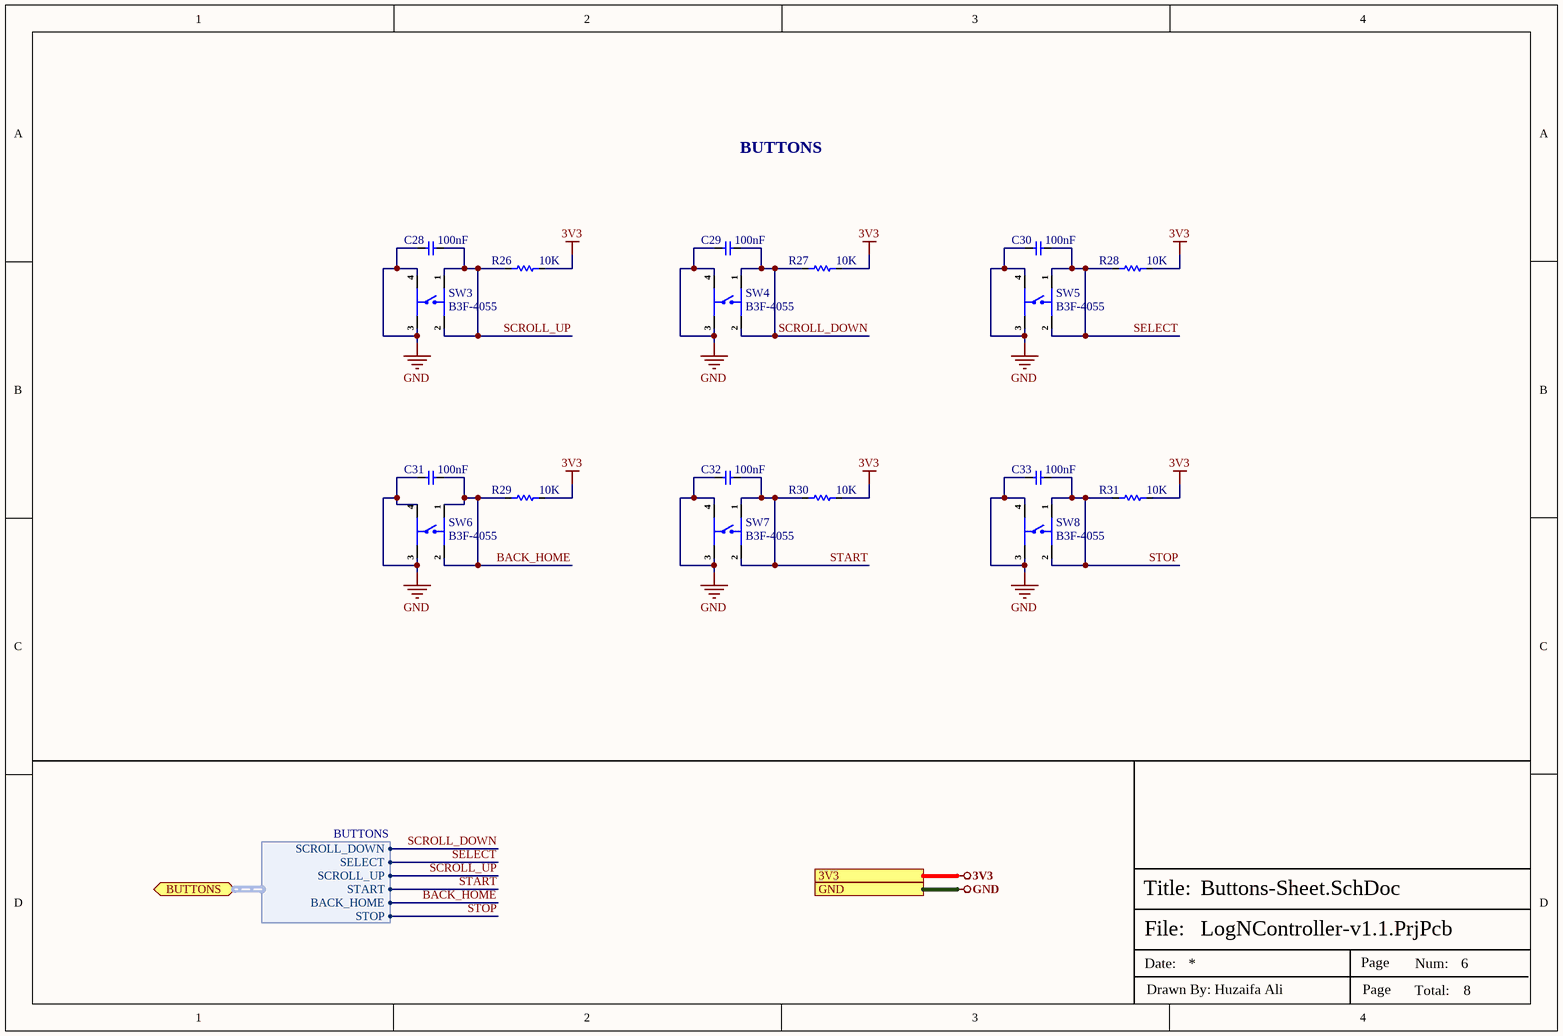
[diagram p4: Buttons-Sheet.SchDoc]

### Parts
C28  100nF  [Cap-0603]
C29  100nF  [Cap-0603]
C30  100nF  [Cap-0603]
C31  100nF  [Cap-0603]
C32  100nF  [Cap-0603]
C33  100nF  [Cap-0603]
R26  10K  [Res-0603]
R27  10K  [Res-0603]
R28  10K  [Res-0603]
R29  10K  [Res-0603]
R30  10K  [Res-0603]
R31  10K  [Res-0603]
SW3  B3F-4055  [B3F-4055]
SW4  B3F-4055  [B3F-4055]
SW5  B3F-4055  [B3F-4055]
SW6  B3F-4055  [B3F-4055]
SW7  B3F-4055  [B3F-4055]
SW8  B3F-4055  [B3F-4055]

### Ports
3V3 (see Top-Sheet[3A], ADC-Sheet[3D], Controller-Sheet[3D], IO-Expander-Sheet[3D], Power-Sheet[3D], Sensor-Comms-Sheet[3D]), BUTTONS (bidir, harness BUTTONS, see Top-Sheet[4A], IO-Expander-Sheet[1D]), GND (see Top-Sheet[3A], ADC-Sheet[3D], Controller-Sheet[3D], IO-Expander-Sheet[3D], Power-Sheet[3D], Relay-Sheet[3D], Sensor-Comms-Sheet[3D])

### Harnesses
BUTTONS: SELECT, SCROLL_DOWN, SCROLL_UP, START, BACK_HOME, STOP

### Nets
3V3: R26.1 R27.1 R28.1 R29.1 R30.1 R31.1 ; port 3V3
GND: C28.2 C29.2 C30.2 C31.2 C32.2 C33.2 SW3.3 SW3.4 SW4.3 SW4.4 SW5.3 SW5.4 SW6.3 SW6.4 SW7.3 SW7.4 SW8.3 SW8.4 ; port GND
BACK_HOME: C31.1 R29.2 SW6.1 SW6.2 ; port BUTTONS.BACK_HOME
SCROLL_DOWN: C29.1 R27.2 SW4.1 SW4.2 ; port BUTTONS.SCROLL_DOWN
SCROLL_UP: C28.1 R26.2 SW3.1 SW3.2 ; port BUTTONS.SCROLL_UP
SELECT: C30.1 R28.2 SW5.1 SW5.2 ; port BUTTONS.SELECT
START: C32.1 R30.2 SW7.1 SW7.2 ; port BUTTONS.START
STOP: C33.1 R31.2 SW8.1 SW8.2 ; port BUTTONS.STOP

### Notes on the sheet
- BUTTONS
- File:
- Title:
- Date:
- Page
- Num:
- Total:
- Drawn By: Huzaifa Ali

### Library data of the parts
C28-C33 = CC0603KRX5R9BB104: as C2 on sheet Power-Sheet; Supplier 1: Digi-Key; Manufacturer Part Number: CC0603KRX5R9BB104; RoHS: Yes; Category: Ceramic Capacitors; Stock 1: 152253; Pricing 1: 1=0.10000, 10=0.05200, 50=0.02820, 100=0.02310, 500=0.01648, 1000=0.01294 (USD); Mount: Surface Mount; Case/Package: 0603; Case Code (Imperial): 0603; Case Code (Metric): 1608; Weight: 7.1E-05oz; Min Operating Temperature: -55°C; Max Operating Temperature: 85°C; Capacitance: 100nF; Packaging: Tape and Reel; Voltage Rating: 50V; Dielectric: X5R; Termination: SMD/SMT; Voltage Rating (DC): 50V; Package Quantity: 4000; Length: 0.063inch; Width: 0.031inch; Thickness: 0.035inch; Lead Free: Lead Free; Halogen Free: Halogen Free; ComponentLink1URL: http://www.mouser.com/ds/2/447/Yageo_UPY-GP_NP0_16V-to-50V_9-358835.pdf?src-supplier=Mouser; ComponentLink1Description: http://www.mouser.com/ds/2/447/Yageo_UPY-GP_NP0_16V-to-50V_9-358835.pdf?src-supplier=Mouser; ComponentLink2URL: https://www.yageo.com/upload/media/product/productsearch/datasheet/mlcc/UPY-GPHC_X5R_4V-to-50V_26.pdf?src-supplier=Digi-Key; ComponentLink2Description: https://www.yageo.com/upload/media/product/productsearch/datasheet/mlcc/UPY-GPHC_X5R_4V-to-50V_26.pdf?src-supplier=Digi-Key; ComponentLink3URL: http://www.yageo.com/exep/pages/download/literatures/ProductSelectionGuide%202014_Final_2.pdf?src-supplier=Digi-Key; ComponentLink3Description: http://www.yageo.com/exep/pages/download/literatures/ProductSelectionGuide%202014_Final_2.pdf?src-supplier=Digi-Key; Supplier Part Number 1: 311-4046-1-ND; LCSC Part Number: C110022
R26-R31 = RC0603FR-0710KL: as R24 on sheet ADC-Sheet; Supplier 1: Digi-Key; Manufacturer Part Number: RC0603FR-0710KL; RoHS: Yes; Category: Chip SMD Resistors; Stock 1: 25249139; Pricing 1: 1=0.10000, 10=0.02400, 100=0.00970, 1000=0.00436, 2500=0.00378 (USD); Case/Package: 0603; Number of Pins: 2; Case Code (Imperial): 0603; Case Code (Metric): 1608; Weight: 7.1E-05oz; Size Code: 0603; Min Operating Temperature: -55°C; Max Operating Temperature: 155°C; Tolerance: 1%; Resistor Type: Thick Film; Packaging: Tape and Reel; Termination: SMD/SMT; Features: Moisture Resistant; Series: RC; Max Power Dissipation: 100mW; Number of Terminations: 2; Resistance Tolerance: 1%; Construction: Rectangular; Length: 1.6mm; Width: 0.8mm; Height: 0.45mm; Depth: 0.8mm; Lead Pitch: 0.3mm; REACH SVHC: Unknown; Lead Free: Lead Free; Military Standard: Not; RoHS Compliant: Yes; ComponentLink1URL: https://datasheet.ciiva.com/7660/38590-7660789.pdf?src-supplier=Element14; ComponentLink1Description: https://datasheet.ciiva.com/7660/38590-7660789.pdf?src-supplier=Element14; ComponentLink2URL: https://datasheet.ciiva.com/7983/443971-7983596.pdf?src-supplier=Element14; ComponentLink2Description: https://datasheet.ciiva.com/7983/443971-7983596.pdf?src-supplier=Element14; ComponentLink3URL: https://datasheet.ciiva.com/22747/443971-22747519.pdf?src-supplier=Element14; ComponentLink3Description: https://datasheet.ciiva.com/22747/443971-22747519.pdf?src-supplier=Element14; ComponentLink4URL: https://datasheet.ciiva.com/46440/1868787-46440891.pdf?src-supplier=Element14; ComponentLink4Description: https://datasheet.ciiva.com/46440/1868787-46440891.pdf?src-supplier=Element14; ComponentLink5URL: https://datasheet.ciiva.com/7746/1738695-7746239.pdf?src-supplier=Element14; ComponentLink5Description: https://datasheet.ciiva.com/7746/1738695-7746239.pdf?src-supplier=Element14; ComponentLink6URL: https://datasheet.ciiva.com/15189/getdatasheetpartid-409289-15189591.pdf?src-supplier=Verical; ComponentLink6Description: https://datasheet.ciiva.com/15189/getdatasheetpartid-409289-15189591.pdf?src-supplier=Verical; Supplier Part Number 1: 311-10.0KHRCT-ND; LCSC Part Number: C98220
SW3-SW8 = B3F-4055: SWITCH TACTILE SPST-NO 0.05A 24V; Manufacturer: Omron; Item Type: Tactile Switche; Number of Positions: 2NUMBER; Supplier: Avnet; Supplier Part Number: 36K1872; Manufacturer Part Number: B3F-4055; RoHS: Yes; Stock: 55; Pricing: 1=0.617, 10=0.574, 25=0.55, 50=0.525, 100=0.501 (USD); Color: 54Colour; Lead Free: 5697LeadFree; ComponentLink1URL: https://datasheet.ciiva.com/27056/2086688-27056647.pdf?src-supplier=Jameco; ComponentLink1Description: https://datasheet.ciiva.com/27056/2086688-27056647.pdf?src-supplier=Jameco; ComponentLink2URL: https://datasheet.ciiva.com/5283/b3f-0811-26083-5283663.pdf?src-supplier=Mouser; ComponentLink2Description: https://datasheet.ciiva.com/5283/b3f-0811-26083-5283663.pdf?src-supplier=Mouser; ComponentLink3URL: https://datasheet.ciiva.com/1532/611570-1532596.pdf?src-supplier=Element14; ComponentLink3Description: https://datasheet.ciiva.com/1532/611570-1532596.pdf?src-supplier=Element14; ComponentLink4URL: https://datasheet.ciiva.com/16154/en-b3f-16154911.pdf?src-supplier=Onlinecomponents.com; ComponentLink4Description: https://datasheet.ciiva.com/16154/en-b3f-16154911.pdf?src-supplier=Onlinecomponents.com; ComponentLink5URL: https://datasheet.ciiva.com/2900/b3f-0811-2900013.pdf?src-supplier=Digikey; ComponentLink5Description: https://datasheet.ciiva.com/2900/b3f-0811-2900013.pdf?src-supplier=Digikey; ComponentLink6URL: https://datasheet.ciiva.com/30212/en-b3f-30212214.pdf?src-supplier=Onlinecomponents.com; ComponentLink6Description: https://datasheet.ciiva.com/30212/en-b3f-30212214.pdf?src-supplier=Onlinecomponents.com; LCSC Part Number: C84931